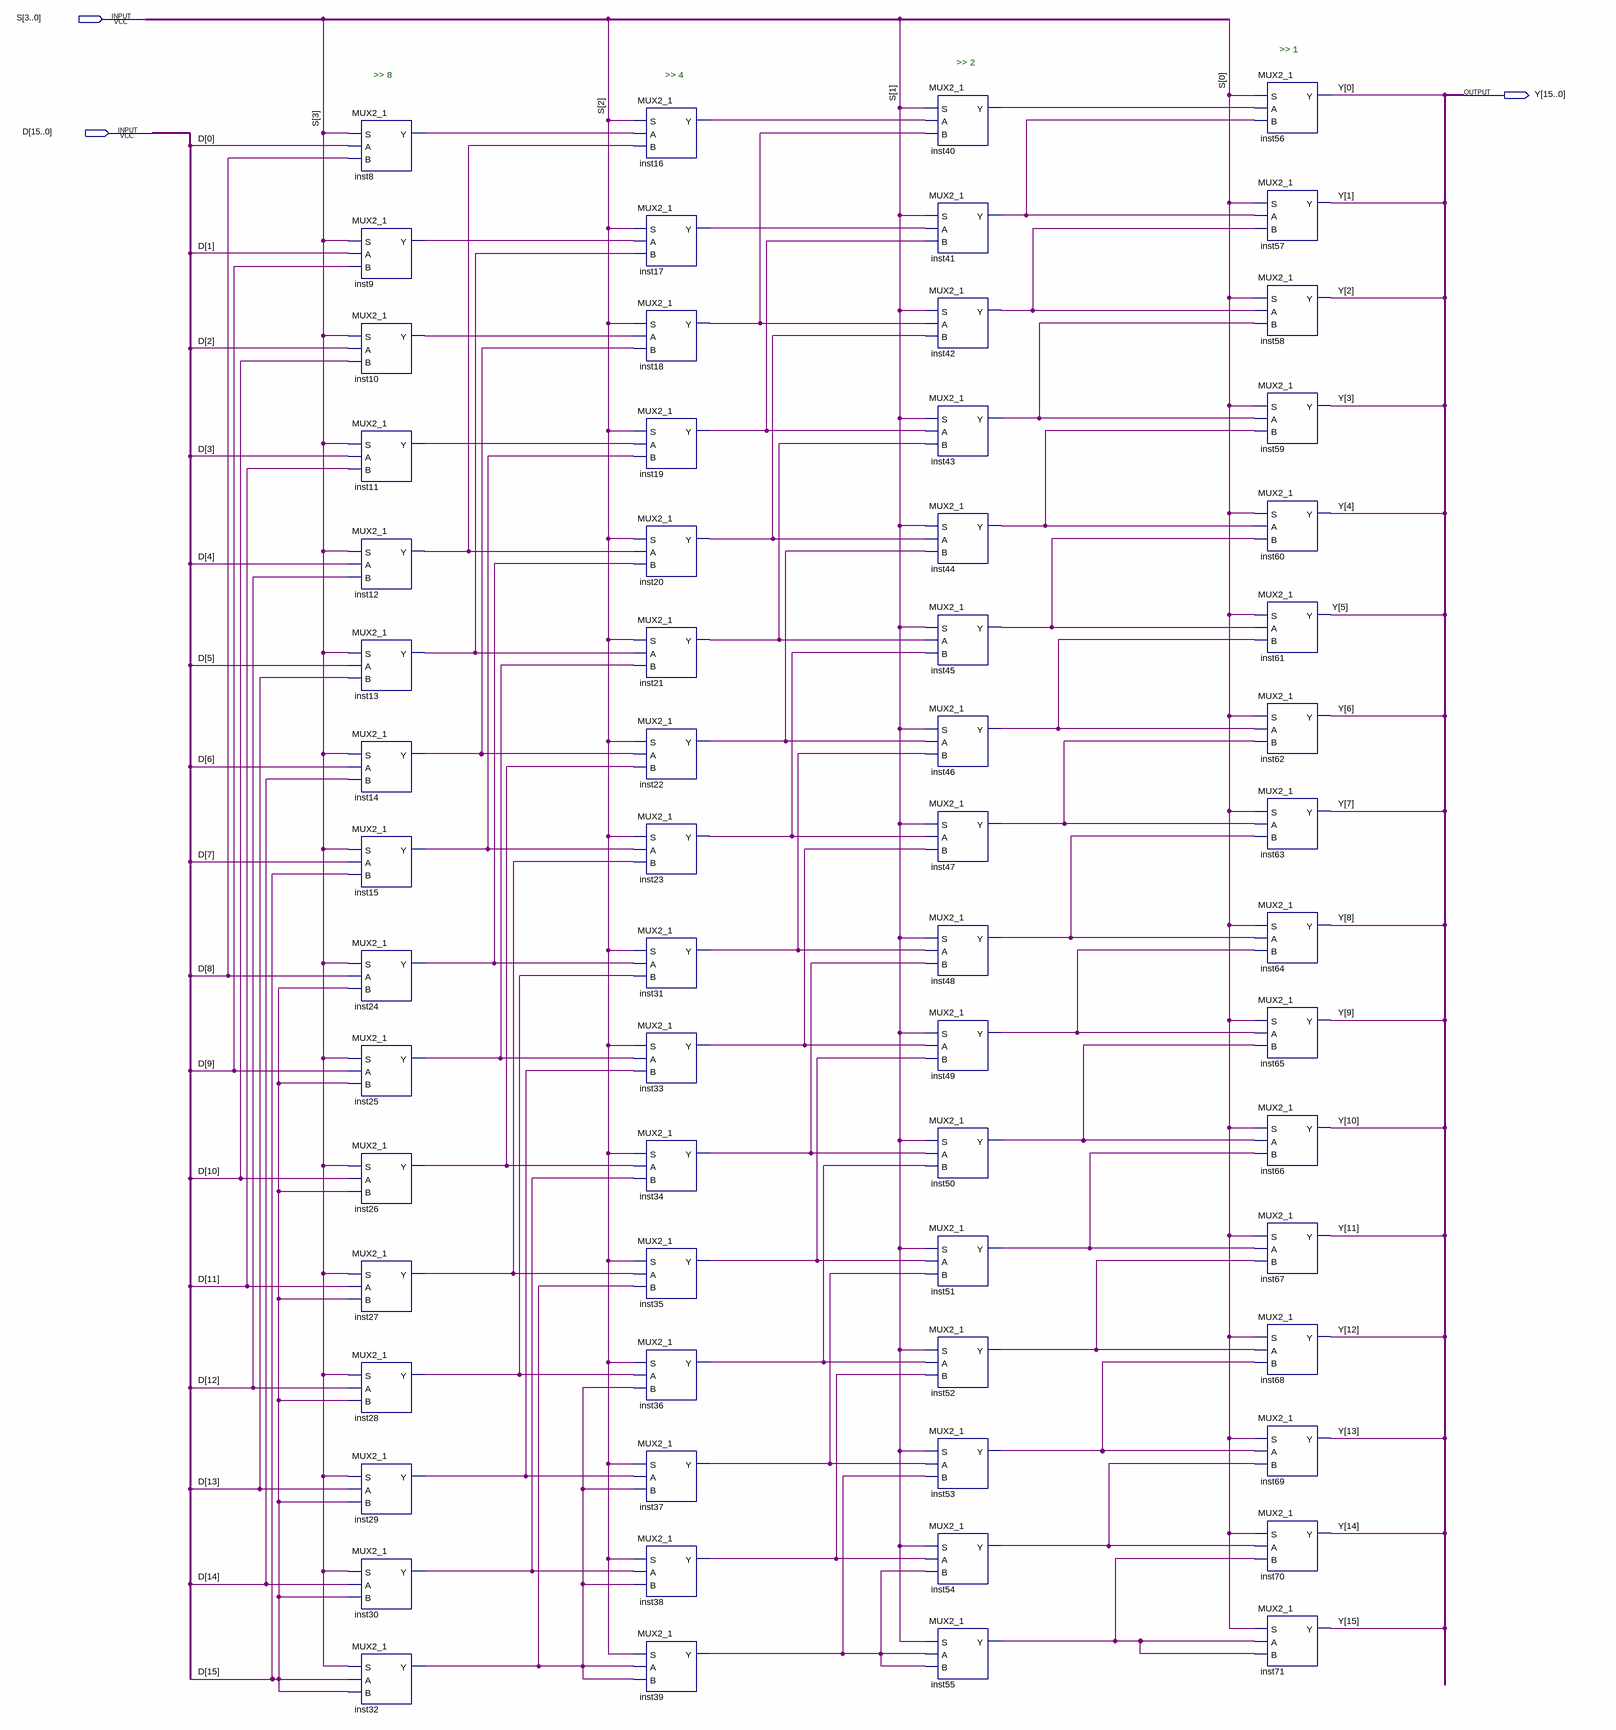
[diagram p0: schematic sheet]
// Quartus schematic Shift_Right_n_bit.bdf as structural Verilog: 64 symbols, 3 pins
module Shift_Right_n_bit (
  input  [3:0] S,
  input  [15:0] D,
  output [15:0] Y
);

  wire inst8_y, inst9_y, inst10_y, inst11_y, inst12_y, inst13_y, inst14_y, inst15_y, inst16_y, inst17_y,
       inst18_y, inst19_y, inst20_y, inst21_y, inst22_y, inst23_y, inst24_y, inst25_y, inst26_y, inst27_y,
       inst28_y, inst29_y, inst30_y, inst31_y, inst32_y, inst33_y, inst34_y, inst35_y, inst36_y, inst37_y,
       inst38_y, inst39_y, inst40_y, inst41_y, inst42_y, inst43_y, inst44_y, inst45_y, inst46_y, inst47_y,
       inst48_y, inst49_y, inst50_y, inst51_y, inst52_y, inst53_y, inst54_y, inst55_y;

  MUX2_1 inst8 (.S(S[3]), .A(D[0]), .B(D[8]), .Y(inst8_y));
  MUX2_1 inst9 (.S(S[3]), .A(D[1]), .B(D[9]), .Y(inst9_y));
  MUX2_1 inst10 (.S(S[3]), .A(D[2]), .B(D[10]), .Y(inst10_y));
  MUX2_1 inst11 (.S(S[3]), .A(D[3]), .B(D[11]), .Y(inst11_y));
  MUX2_1 inst12 (.S(S[3]), .A(D[4]), .B(D[12]), .Y(inst12_y));
  MUX2_1 inst13 (.S(S[3]), .A(D[5]), .B(D[13]), .Y(inst13_y));
  MUX2_1 inst14 (.S(S[3]), .A(D[6]), .B(D[14]), .Y(inst14_y));
  MUX2_1 inst15 (.S(S[3]), .A(D[7]), .B(D[15]), .Y(inst15_y));
  MUX2_1 inst24 (.S(S[3]), .A(D[8]), .B(D[15]), .Y(inst24_y));
  MUX2_1 inst25 (.S(S[3]), .A(D[9]), .B(D[15]), .Y(inst25_y));
  MUX2_1 inst26 (.S(S[3]), .A(D[10]), .B(D[15]), .Y(inst26_y));
  MUX2_1 inst27 (.S(S[3]), .A(D[11]), .B(D[15]), .Y(inst27_y));
  MUX2_1 inst28 (.S(S[3]), .A(D[12]), .B(D[15]), .Y(inst28_y));
  MUX2_1 inst29 (.S(S[3]), .A(D[13]), .B(D[15]), .Y(inst29_y));
  MUX2_1 inst30 (.S(S[3]), .A(D[14]), .B(D[15]), .Y(inst30_y));
  MUX2_1 inst32 (.S(S[3]), .A(D[15]), .B(D[15]), .Y(inst32_y));
  MUX2_1 inst16 (.S(S[2]), .A(inst8_y), .B(inst12_y), .Y(inst16_y));
  MUX2_1 inst17 (.S(S[2]), .A(inst9_y), .B(inst13_y), .Y(inst17_y));
  MUX2_1 inst18 (.S(S[2]), .A(inst10_y), .B(inst14_y), .Y(inst18_y));
  MUX2_1 inst19 (.S(S[2]), .A(inst11_y), .B(inst15_y), .Y(inst19_y));
  MUX2_1 inst20 (.S(S[2]), .A(inst12_y), .B(inst24_y), .Y(inst20_y));
  MUX2_1 inst21 (.S(S[2]), .A(inst13_y), .B(inst25_y), .Y(inst21_y));
  MUX2_1 inst22 (.S(S[2]), .A(inst14_y), .B(inst26_y), .Y(inst22_y));
  MUX2_1 inst23 (.S(S[2]), .A(inst15_y), .B(inst27_y), .Y(inst23_y));
  MUX2_1 inst31 (.S(S[2]), .A(inst24_y), .B(inst28_y), .Y(inst31_y));
  MUX2_1 inst33 (.S(S[2]), .A(inst25_y), .B(inst29_y), .Y(inst33_y));
  MUX2_1 inst34 (.S(S[2]), .A(inst26_y), .B(inst30_y), .Y(inst34_y));
  MUX2_1 inst35 (.S(S[2]), .A(inst27_y), .B(inst32_y), .Y(inst35_y));
  MUX2_1 inst36 (.S(S[2]), .A(inst28_y), .B(inst32_y), .Y(inst36_y));
  MUX2_1 inst37 (.S(S[2]), .A(inst29_y), .B(inst32_y), .Y(inst37_y));
  MUX2_1 inst38 (.S(S[2]), .A(inst30_y), .B(inst32_y), .Y(inst38_y));
  MUX2_1 inst39 (.S(S[2]), .A(inst32_y), .B(inst32_y), .Y(inst39_y));
  MUX2_1 inst40 (.S(S[1]), .A(inst16_y), .B(inst18_y), .Y(inst40_y));
  MUX2_1 inst41 (.S(S[1]), .A(inst17_y), .B(inst19_y), .Y(inst41_y));
  MUX2_1 inst42 (.S(S[1]), .A(inst18_y), .B(inst20_y), .Y(inst42_y));
  MUX2_1 inst43 (.S(S[1]), .A(inst19_y), .B(inst21_y), .Y(inst43_y));
  MUX2_1 inst44 (.S(S[1]), .A(inst20_y), .B(inst22_y), .Y(inst44_y));
  MUX2_1 inst45 (.S(S[1]), .A(inst21_y), .B(inst23_y), .Y(inst45_y));
  MUX2_1 inst46 (.S(S[1]), .A(inst22_y), .B(inst31_y), .Y(inst46_y));
  MUX2_1 inst47 (.S(S[1]), .A(inst23_y), .B(inst33_y), .Y(inst47_y));
  MUX2_1 inst48 (.S(S[1]), .A(inst31_y), .B(inst34_y), .Y(inst48_y));
  MUX2_1 inst49 (.S(S[1]), .A(inst33_y), .B(inst35_y), .Y(inst49_y));
  MUX2_1 inst50 (.S(S[1]), .A(inst34_y), .B(inst36_y), .Y(inst50_y));
  MUX2_1 inst51 (.S(S[1]), .A(inst35_y), .B(inst37_y), .Y(inst51_y));
  MUX2_1 inst52 (.S(S[1]), .A(inst36_y), .B(inst38_y), .Y(inst52_y));
  MUX2_1 inst53 (.S(S[1]), .A(inst37_y), .B(inst39_y), .Y(inst53_y));
  MUX2_1 inst54 (.S(S[1]), .A(inst38_y), .B(inst39_y), .Y(inst54_y));
  MUX2_1 inst55 (.S(S[1]), .A(inst39_y), .B(inst39_y), .Y(inst55_y));
  MUX2_1 inst56 (.S(S[0]), .A(inst40_y), .B(inst41_y), .Y(Y[0]));
  MUX2_1 inst57 (.S(S[0]), .A(inst41_y), .B(inst42_y), .Y(Y[1]));
  MUX2_1 inst58 (.S(S[0]), .A(inst42_y), .B(inst43_y), .Y(Y[2]));
  MUX2_1 inst59 (.S(S[0]), .A(inst43_y), .B(inst44_y), .Y(Y[3]));
  MUX2_1 inst60 (.S(S[0]), .A(inst44_y), .B(inst45_y), .Y(Y[4]));
  MUX2_1 inst61 (.S(S[0]), .A(inst45_y), .B(inst46_y), .Y(Y[5]));
  MUX2_1 inst62 (.S(S[0]), .A(inst46_y), .B(inst47_y), .Y(Y[6]));
  MUX2_1 inst63 (.S(S[0]), .A(inst47_y), .B(inst48_y), .Y(Y[7]));
  MUX2_1 inst64 (.S(S[0]), .A(inst48_y), .B(inst49_y), .Y(Y[8]));
  MUX2_1 inst65 (.S(S[0]), .A(inst49_y), .B(inst50_y), .Y(Y[9]));
  MUX2_1 inst66 (.S(S[0]), .A(inst50_y), .B(inst51_y), .Y(Y[10]));
  MUX2_1 inst67 (.S(S[0]), .A(inst51_y), .B(inst52_y), .Y(Y[11]));
  MUX2_1 inst68 (.S(S[0]), .A(inst52_y), .B(inst53_y), .Y(Y[12]));
  MUX2_1 inst69 (.S(S[0]), .A(inst53_y), .B(inst54_y), .Y(Y[13]));
  MUX2_1 inst70 (.S(S[0]), .A(inst54_y), .B(inst55_y), .Y(Y[14]));
  MUX2_1 inst71 (.S(S[0]), .A(inst55_y), .B(inst55_y), .Y(Y[15]));

  // Notes on the sheet:
  //   >> 1
  //   >> 2
  //   >> 8
  //   >> 4
endmodule
